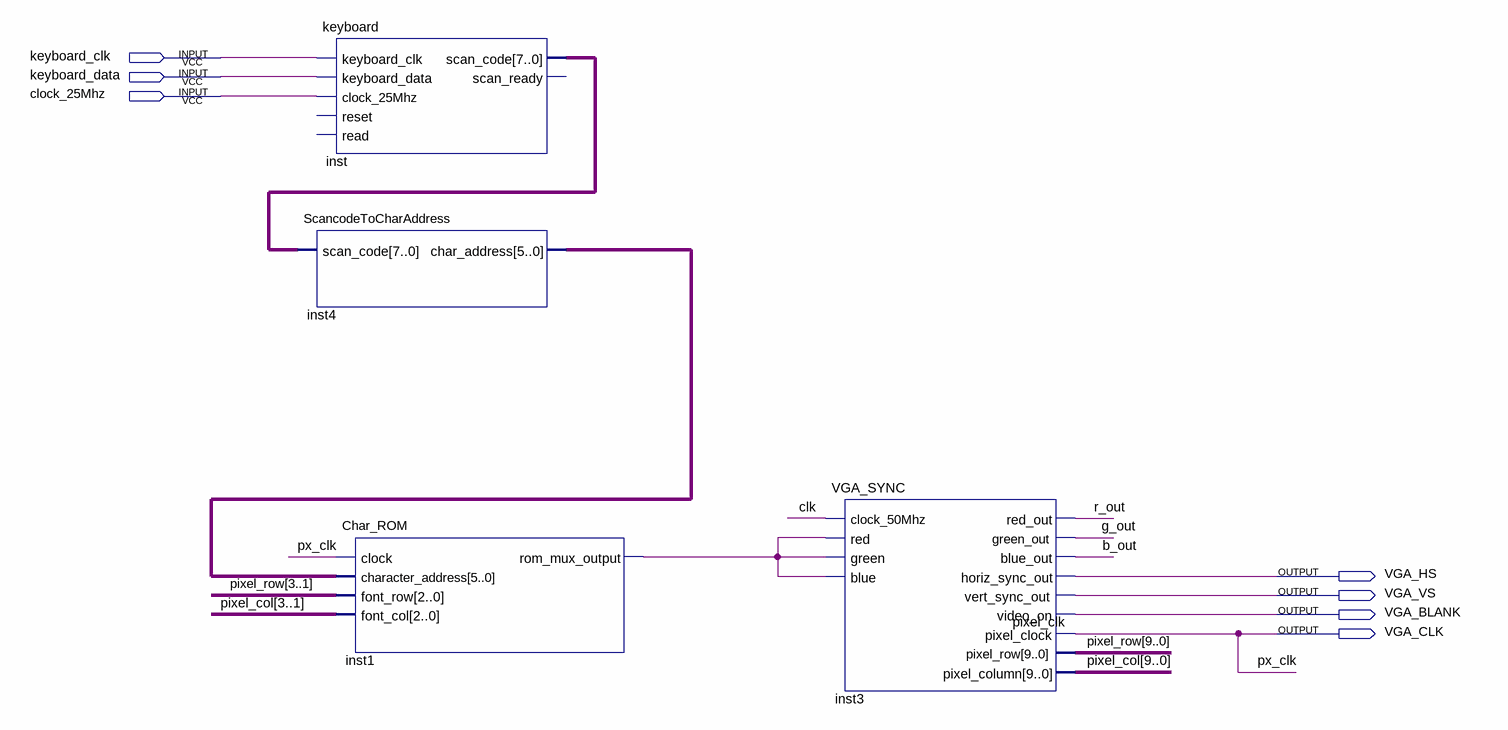
[diagram p0: schematic sheet]
// Quartus schematic editor_texto.bdf as structural Verilog: 4 symbols, 7 pins
module editor_texto (
  input  keyboard_clk,
  input  keyboard_data,
  input  clock_25Mhz,
  output VGA_HS,
  output VGA_VS,
  output VGA_BLANK,
  output VGA_CLK
);

  wire b_out, clk, g_out, inst1_rom_mux_output, r_out;
  wire [5:0] inst4_char_address;
  wire [7:0] inst_scan_code;
  wire [9:0] pixel_col, pixel_row;

  keyboard inst (
    .keyboard_clk(keyboard_clk), .keyboard_data(keyboard_data), .clock_25Mhz(clock_25Mhz),
    .scan_code(inst_scan_code));  // open: reset, read, scan_ready
  ScancodeToCharAddress inst4 (.scan_code(inst_scan_code), .char_address(inst4_char_address));
  Char_ROM inst1 (
    .clock(VGA_CLK), .character_address(inst4_char_address), .font_row(pixel_row[3:1]),
    .font_col(pixel_col[3:1]), .rom_mux_output(inst1_rom_mux_output));
  VGA_SYNC inst3 (
    .clock_50Mhz(clk), .red(inst1_rom_mux_output), .green(inst1_rom_mux_output), .blue(inst1_rom_mux_output),
    .red_out(r_out), .green_out(g_out), .blue_out(b_out), .horiz_sync_out(VGA_HS), .vert_sync_out(VGA_VS),
    .video_on(VGA_BLANK), .pixel_clock(VGA_CLK), .pixel_row(pixel_row), .pixel_column(pixel_col));

  // Other names for the same wires on the sheet: pixel_clk = VGA_CLK; px_clk = VGA_CLK
endmodule
